# Altium schematic sheet Headers.SchDoc
size A; SheetNumber: 9; SheetTotal: 9
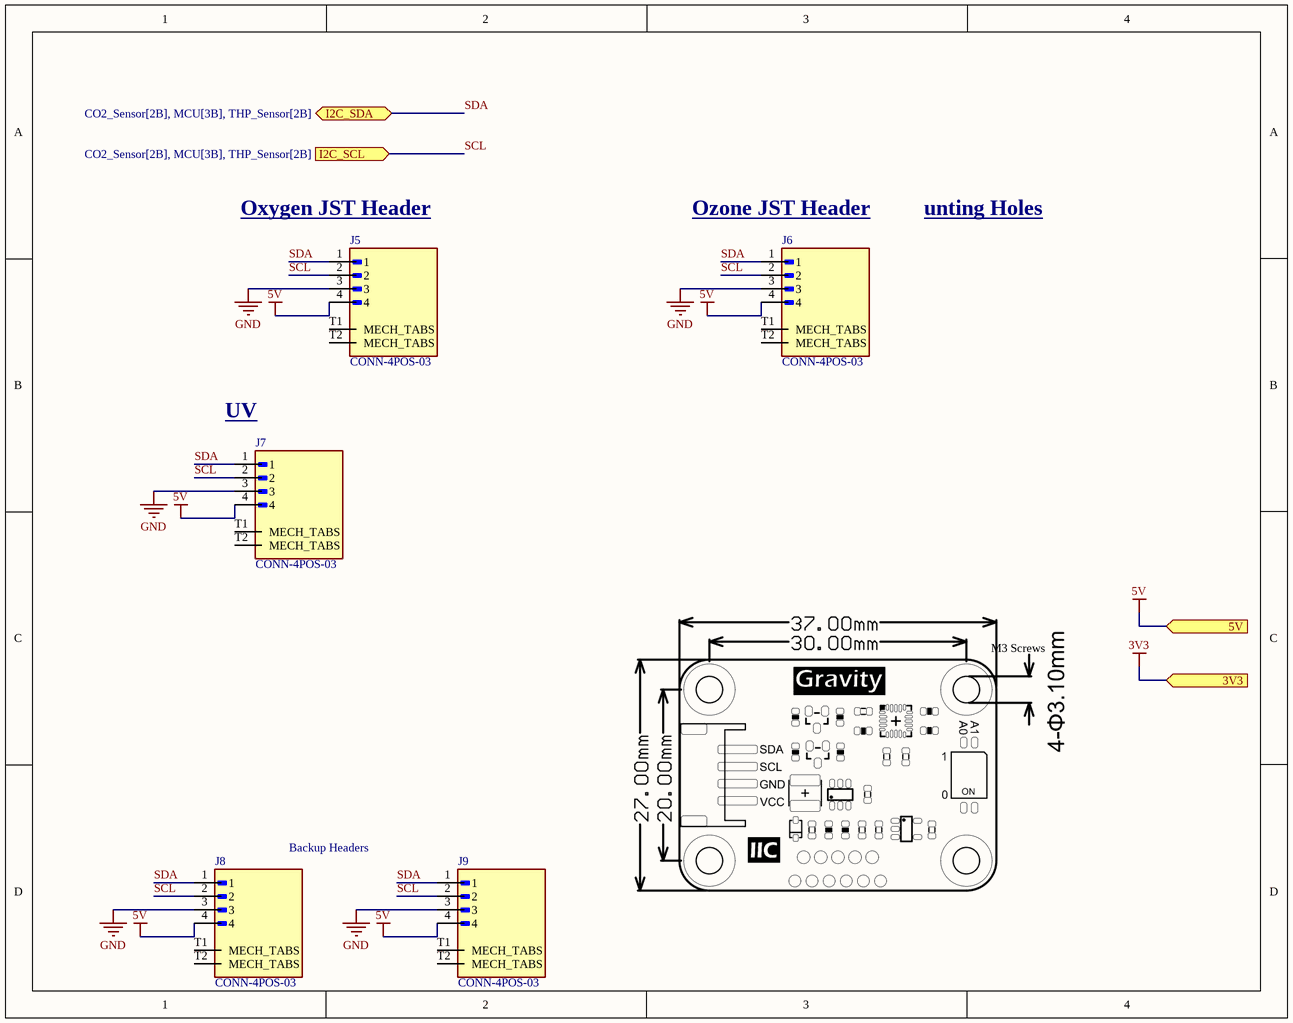
[diagram p0: Headers.SchDoc]

## Parts
J5  CONN-4POS-03  [CONN-4POS-03]
J6  CONN-4POS-03  [CONN-4POS-03]
J7  CONN-4POS-03  [CONN-4POS-03]
J8  CONN-4POS-03  [CONN-4POS-03]
J9  CONN-4POS-03  [CONN-4POS-03]

## Ports
3V3 (in), 5V (in), I2C_SCL (in, see CO2_Sensor[2B], MCU[3B], THP_Sensor[2B]), I2C_SDA (bidir, see CO2_Sensor[2B], MCU[3B], THP_Sensor[2B])

## Nets
3V3: port 3V3
5V: J5.4 J6.4 J7.4 J8.4 J9.4 ; port 5V
GND: J5.3 J6.3 J7.3 J8.3 J9.3
SCL: J5.2 J6.2 J7.2 J8.2 J9.2 ; port I2C_SCL
SDA: J5.1 J6.1 J7.1 J8.1 J9.1 ; port I2C_SDA

Not connected (* = marked no-connect by the designer): J5 T1(MECH_TABS) T2(MECH_TABS); J6 T1(MECH_TABS) T2(MECH_TABS); J7 T1(MECH_TABS) T2(MECH_TABS); J8 T1(MECH_TABS) T2(MECH_TABS); J9 T1(MECH_TABS) T2(MECH_TABS)

## Notes on the sheet
- (near J5) Oxygen JST Header
- (near J6) Ozone JST Header
- unting Holes
- (near J7) UV
  UV JST Header
- M3 Screws
- Backup Headers

## Library data of the parts
J5-J9 = CONN-4POS-03: Connector Header Surface Mount, Right Angle 4 position 0.079" (2.00mm); MPN: S4B-PH-SM4-TB; MANUFACTURER: JST Sales; UNIT: MM; MAXIMUM_PACKAGE_HEIGHT: 5.5mm; Value: *; SOURCE_URL: https://www.snapeda.com/parts/S4B-PH-SM4-TB/JST/view-part/; DATASHEET_URL: https://s3.amazonaws.com/snapeda/datasheet/S4B-PH-SM4-TB_JST.pdf; STANDARD: Manufacturer Recommendations